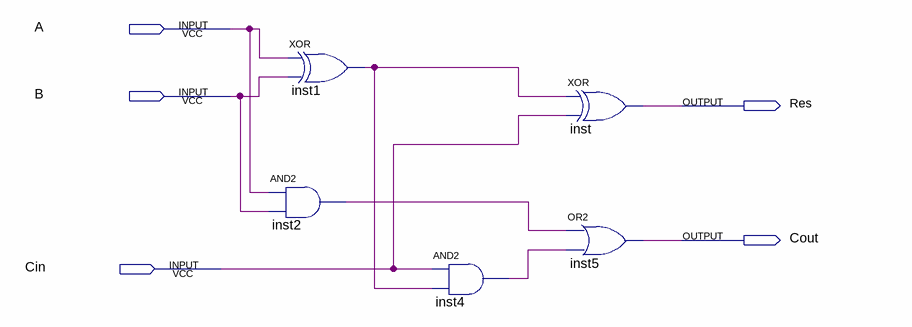
[diagram p0: schematic sheet]
// Quartus schematic FullAdder.bdf as structural Verilog: 5 symbols, 5 pins
module FullAdder (
  input  A,
  input  B,
  input  Cin,
  output Res,
  output Cout
);

  wire inst1_out, inst2_out, inst4_out;

  xor inst1 (inst1_out, A, B);
  and inst2 (inst2_out, A, B);
  and inst4 (inst4_out, Cin, inst1_out);
  xor inst (Res, inst1_out, Cin);
  or inst5 (Cout, inst2_out, inst4_out);
endmodule
